# Altium project LTE-GNSS Asset Tracker.PrjPcb (part 1 of 3)
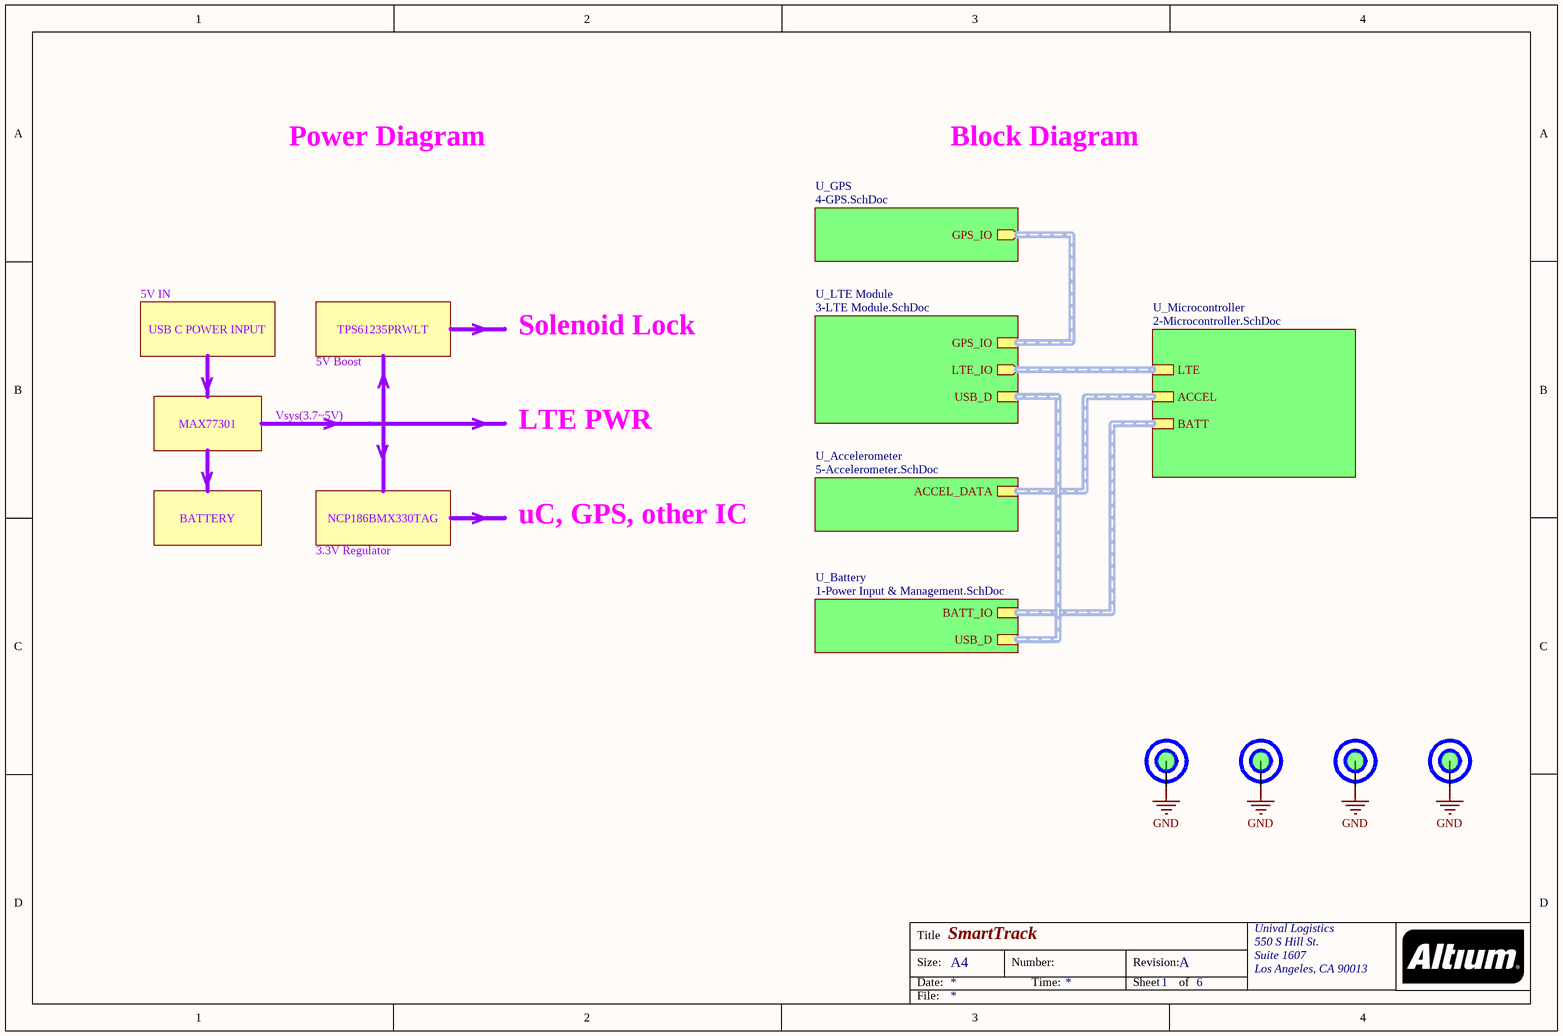
[diagram p0: Top.SchDoc]
6 sheets, 158 parts. Net scope: hierarchical (ports join the sheet entries above them; power ports are global).
Board file: LTE GNSS Tracker.PcbDoc
Sheets:
  Top.SchDoc
    U_Battery = 1-Power Input & Management.SchDoc
    U_LTE Module = 3-LTE Module.SchDoc
    U_GPS = 4-GPS.SchDoc
    U_Accelerometer = 5-Accelerometer.SchDoc
    U_Microcontroller = 2-Microcontroller.SchDoc

## Sheet Top.SchDoc: SmartTrack
size A4; Engineer: ZMP; Organization: Unival Logistics; Address1: 550 S Hill St.; Address2: Suite 1607; Address3: Los Angeles, CA 90013; Revision: A; SheetNumber: 1; SheetTotal: 6

### Parts
MNT1  MOUNTING HOLE  [MNT620-275N]  (value not drawn)
MNT2  MOUNTING HOLE  [MNT620-275N]  (value not drawn)
MNT3  MOUNTING HOLE  [MNT620-275N]  (value not drawn)
MNT4  MOUNTING HOLE  [MNT620-275N]  (value not drawn)

### Sub-sheets
U_Accelerometer = 5-Accelerometer.SchDoc: ACCEL_DATA (harness ACCEL)
U_Battery = 1-Power Input & Management.SchDoc: BATT_IO (harness I2C), USB_D (harness USB)
U_GPS = 4-GPS.SchDoc: GPS_IO (out, harness GPS)
U_LTE Module = 3-LTE Module.SchDoc: LTE_IO (out, harness LTE), GPS_IO (harness GPS), USB_D (harness USB)
U_Microcontroller = 2-Microcontroller.SchDoc: ACCEL (harness ACCEL), LTE (harness LTE), BATT (harness I2C)

### Nets
GND: MNT1.1(GND) MNT2.1(GND) MNT3.1(GND) MNT4.1(GND)

### Buses and harness runs
harness sheet U_Accelerometer/ACCEL_DATA = sheet U_Microcontroller/ACCEL
harness sheet U_Battery/BATT_IO = sheet U_Microcontroller/BATT
harness sheet U_Battery/USB_D = sheet U_LTE Module/USB_D
harness sheet U_GPS/GPS_IO = sheet U_LTE Module/GPS_IO
harness sheet U_LTE Module/LTE_IO = sheet U_Microcontroller/LTE

### Notes on the sheet
- Power Diagram
- Block Diagram
- 5V IN
- USB C POWER INPUT
- 5V Boost
- TPS61235PRWLT
- V
- Solenoid Lock
- MAX77301
- Vsys(3.7~5V)
- LTE PWR
- BATTERY
- NCP186BMX330TAG
- 3.3V Regulator
- uC, GPS, other IC
- Title
- Size:
- Date:
- A4
- Number:
- Time:
- Revision:
- Sheet
- of
- File:

### Library data of the parts
MNT1-MNT4 = MNT_1: Part #: NA; Notes: PCB; Emcraft #: NA

## Sheet 1-Power Input & Management.SchDoc: Power Input & Management
size A4; Organization: Unival Logistics; Address1: 550 S Hill St.; Address2: Suite 1607; Address3: Los Angeles, CA 90013; Revision: A; SheetNumber: 2; SheetTotal: 6
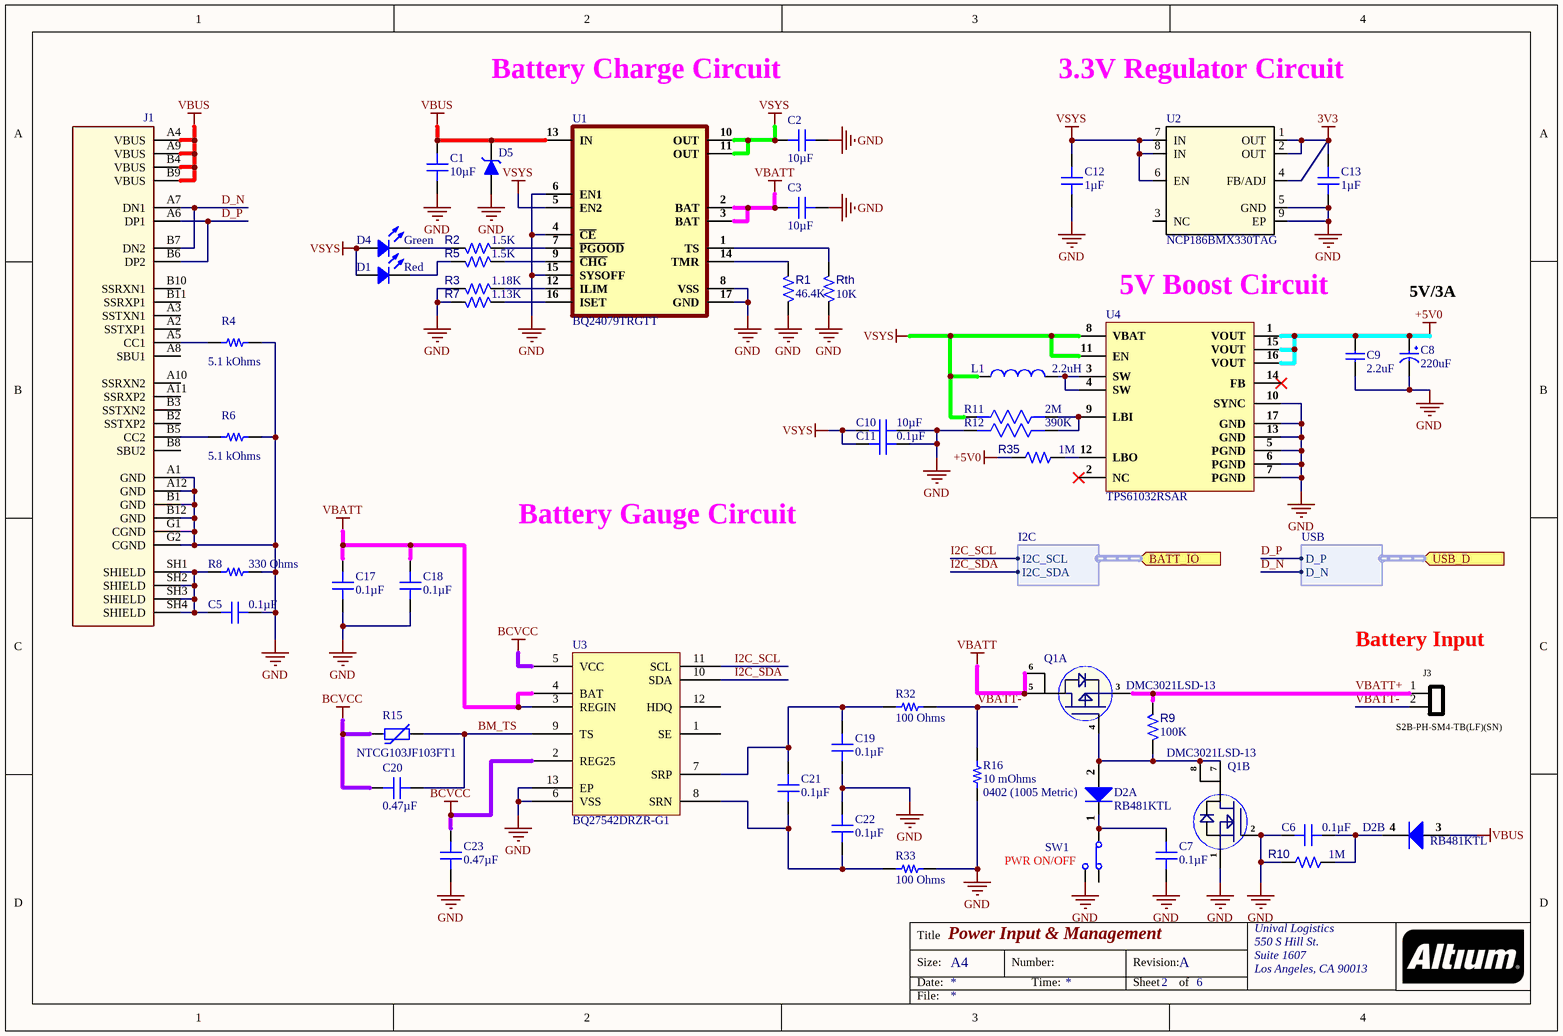
[diagram p1: 1-Power Input & Management.SchDoc]

### Parts
C1  10µF  [CAPC1608X06L]
C2  10µF  [CAPC1608X06L]
C3  10µF  [CAPC1608X06L]
C5  0.1µF  [CAP 0201_0603]
C6  0.1µF  [CAP 0201_0603]
C7  0.1µF  [CAP 0201_0603]
C8  220uF  [T491D227K016AT]
C9  2.2uF  [CAP 0201]
C10  10µF  [Cap 0603]
C11  0.1µF  [CAP 0201]
C12  1µF  [CAP 0402_1005]
C13  1µF  [CAP 0402_1005]
C17  0.1µF  [CAP 0201_0603]
C18  0.1µF  [CAP 0201_0603]
C19  0.1µF  [CAP 0201_0603]
C20  0.47µF  [CAP 0201_0603]
C21  0.1µF  [CAP 0201_0603]
C22  0.1µF  [CAP 0201_0603]
C23  0.47µF  [CAP 0201_0603]
D1  Red  [LED 0402_1005 RED]
D2  RB481KTL  [RB481KTL]  (parts A,B of 2)
D4  Green  [LED 0402_1005 GREEN]
D5  BZT52C6V2S-F2-0000HF  [BZT52C6V2S-F2-0000HF]  (value not drawn)
J1  632723100011  [632723100011]  (value not drawn)
J3  S2B-PH-SM4-TB(LF)(SN)  [JST_S2B-PH-SM4-TB(LF)(SN)]
L1  2.2uH  [NRS8030T2R2NJGJ]
Q1  DMC3021LSD-13  [DMC2020USD-13]  (parts A,B of 2)
R1  46.4K  [RES 0201_0603]
R2  1.5K  [RES 0201_0603]
R3  1.18K  [RES 0201_0603]
R4  5.1 kOhms  [RES 0201_0603]
R5  1.5K  [RES 0201_0603]
R6  5.1 kOhms  [RES 0201_0603]
R7  1.13K  [RES 0201_0603]
R8  330 Ohms  [RES 0201_0603]
R9  100K  [RES 0201_0603]
R10  1M  [RES 0201_0603]
R11  2M  [Res-0201]
R12  390K  [Res-0201]
R15  NTCG103JF103FT1  [NTC 0402_1005]
R16  10 mOhms  Package / Case: 0402 (1005 Metric)  [STACKPOLE CSR0402]
R32  100 Ohms  [RES 0201_0603]
R33  100 Ohms  [RES 0201_0603]
R35  1M  [Res-0201]
Rth  10K  [STACKPOLE CSR0402]
SW1  PWR ON/OFF  [SW_JS102011JCQN]
U1  BQ24079TRGTT  [BQ24079TRGTT]
U2  NCP186BMX330TAG  [8-XDFN]
U3  BQ27542DRZR-G1  [TI SON-12 DRZ]
U4  TPS61032RSAR  [TPS61032RSAR]

### Ports
BATT_IO (in, harness I2C), USB_D (in, harness USB)

### Harnesses
I2C: I2C_SCL, I2C_SDA
USB: D_P, D_N

### Nets
3V3: C13.2 U2.1(OUT) U2.2(OUT) U2.4(FB/ADJ)
+5V0: C8.1 C9.2 R35.1 U4.1(VOUT) U4.15(VOUT) U4.16(VOUT)
BCVCC: C20.1 C23.2 R15.1 U3.2(REG25) U3.5(VCC)
GND: C1.1 C2.1 C3.1 C5.1 C6.1 C7.1 C8.2 C9.1 C10.1 C11.1 C12.1 C13.1 C17.1 C18.1 C19.1 C22.2 C23.1 D5.2(A) J1.A1(GND) J1.A12(GND) J1.B1(GND) J1.B12(GND) J1.G1(CGND) J1.G2(CGND) Q1.1(S2) Q1.2(G2) R1.2 R3.1 R4.2 R6.2 R7.2 R8.2 R10.1 R12.2 R16.1 R33.2 Rth.2 SW1.3 U1.4(~{CE}) U1.6(EN1) U1.8(VSS) U1.15(SYSOFF) U1.17(GND) U2.5(GND) U2.9(EP) U3.6(VSS) U3.13(EP) U4.5(PGND) U4.6(PGND) U4.7(PGND) U4.10(SYNC) U4.13(GND) U4.17(GND)
VBATT: C3.2 C17.2 C18.2 Q1.5(D1) Q1.6(D1) U1.2(BAT) U1.3(BAT) U3.3(REGIN) U3.4(BAT)
VBUS: C1.2 D2.3(A) D5.1(K) J1.A4(VBUS) J1.A9(VBUS) J1.B4(VBUS) J1.B9(VBUS) U1.13(IN)
VSYS: C2.2 C10.2 C11.2 C12.2 D1.1 D4.1 L1.1 R11.2 U1.5(EN2) U1.10(OUT) U1.11(OUT) U2.6(EN) U2.7(IN) U2.8(IN) U4.8(VBAT) U4.11(EN)
BM_TS: C20.2 R15.2 U3.9(TS)
D_N: J1.A7(DN1) J1.B7(DN2) ; port USB_D.D_N
D_P: J1.A6(DP1) J1.B6(DP2) ; port USB_D.D_P
I2C_SCL: U3.11(SCL) ; port BATT_IO.I2C_SCL
I2C_SDA: U3.10(SDA) ; port BATT_IO.I2C_SDA
VBATT+: J3.1(Pin) Q1.3(S1) R9.2
VBATT-: J3.2(Pin) R16.2 R32.2
NetC5_2: C5.2 J1.SH1(SHIELD) J1.SH2(SHIELD) J1.SH3(SHIELD) J1.SH4(SHIELD) R8.1
NetC6_2: C6.2 D2.4(K) R10.2
NetC7_2: C7.2 D2.1(K) SW1.2
NetC19_2: C19.2 C21.2 R32.1 U3.7(SRP)
NetC21_1: C21.1 C22.1 R33.1 U3.8(SRN)
NetD1_2: D1.2 R5.2
NetD2_2: D2.2(A) Q1.4(G1) Q1.7(D2) Q1.8(D2) R9.1
NetD4_2: D4.2 R2.2
NetJ1_A5: J1.A5(CC1) R4.1
NetJ1_B5: J1.B5(CC2) R6.1
NetL1_2: L1.2 U4.3(SW) U4.4(SW)
NetR1_1: R1.1 U1.14(TMR)
NetR2_1: R2.1 U1.7(~{PGOOD})
NetR3_2: R3.2 U1.12(ILIM)
NetR5_1: R5.1 U1.9(~{CHG})
NetR7_1: R7.1 U1.16(ISET)
NetR11_1: R11.1 R12.1 U4.9(LBI)
NetR35_2: R35.2 U4.12(LBO)
NetRth_1: Rth.1 U1.1(TS)

Not connected (* = marked no-connect by the designer): J1 A2(SSTXP1) A3(SSTXN1) A8(SBU1) A10(SSRXN2) A11(SSRXP2) B2(SSTXP2) B3(SSTXN2) B8(SBU2) B10(SSRXN1) B11(SSRXP1); SW1 1; U2 3(NC); U3 1(SE) 12(HDQ); U4 2(NC)* 14(FB)*

### Notes on the sheet
- Battery Charge Circuit
- 3.3V Regulator Circuit
- 5V Boost Circuit
- 5V/3A
- Battery Gauge Circuit
- (near J3) Battery Input
- Title
- Size:
- Date:
- A4
- Number:
- Time:
- Revision:
- Sheet
- of
- File:

### Library data of the parts
C1-C3 C10 = Capacitor: CAP CER 10UF 16V X5R 0603; Part Number: C1608X5R1C106M080AB; Manufacturer: TDK Corporation; Tolerance: ±10%; Value: 10µF; Applications: General Purpose; Capacitance: 10µF; ComponentLink1Description: Datasheet; ComponentLink1URL: http://www.samsungsem.com/kr/support/product-search/mlcc/CL32B106KBJNNNE .jsp; ComponentLink2Description: DigiKey Link; ComponentLink2URL: http://digikey.com/product-detail/en/samsung-electro-mechanics/CL32B106KBJNNNE/1276-3387-1-ND/3891473; Device Package: 0603 (1608 Metric); LastUpdated: 21/01/2020 00:30:21; Lifecycle Status: Active; Minimum Order: 1; Mounting Type: Surface Mount, MLCC; Operating Temperature: -55°C ~ 125°C; Package / Case: 0603 (1608 Metric); Packaging: TapeAndReel; PartId: 24115; Part Status: Active; Price: 0.17; Series: CL; Size / Dimension: 0.063" L x 0.031" W (1.60mm x 0.80mm); Supplier 1: DigiKey; Supplier Part Number 1: 445-9065-2-ND; Temperature Coefficient: X5R; Thickness (Max): 0.106" (2.70mm); Voltage - Rated: 16V
C5-C7 = GRM033R61C104ME84D: CAP CER 0.1UF 16V X5R 0201; Manufacturer: Murata Electronics; Tolerance: ±20%; Part Number: GRM033R61C104ME84D; Value: 0.1µF; Applications: General Purpose; Capacitance: 0.1µF; ComponentLink1Description: Datasheet; ComponentLink1URL: https://search.murata.co.jp/Ceramy/image/img/A01X/G101/ENG/GRM033R61C104ME84-01.pdf; ComponentLink2Description: DigiKey Link; ComponentLink2URL: http://digikey.com/product-detail/en/murata-electronics/GRM033R61C104ME84D/490-9986-1-ND/5026291; Device Package: 0201 (0603 Metric); LastUpdated: 21/01/2020 00:00:12; Lifecycle Status: Active; Minimum Order: 1; Mounting Type: Surface Mount, MLCC; Operating Temperature: -55°C ~ 85°C; Package / Case: 0201 (0603 Metric); Packaging: TapeAndReel; PartId: 1522; Part Status: Active; Price: 0.01; Series: GRM; Size / Dimension: 0.024" L x 0.012" W (0.60mm x 0.30mm); Supplier 1: DigiKey; Supplier Part Number 1: 490-9986-1-ND; Temperature Coefficient: X5R; Thickness (Max): 0.013" (0.33mm); Voltage - Rated: 16V
C8 = T491D227K016AT: CAP TANT 220UF 10% 16V 2917; Manufacturer: KEMET; Dielectric Material: Tantalum; ESR (Equivalent Series Resistance): 900mR; Leakage Current: 35.2uA; Supplier 1: RSComponents; Manufacturer Part Number: T491D227K016AT; RoHS: Yes; Category: Tantalum Capacitors; Stock 1: 35; Pricing 1: 5=2.59000, 50=2.41000, 100=2.25400, 250=2.09800, 500=1.89100 (USD); Mount: Surface Mount; Case/Package: 2917; Number of Pins: 2; Case Code (Metric): 7343; Case Code (Imperial): 2917; Min Operating Temperature: -55°C; Max Operating Temperature: 125°C; Packaging: Cut Tape; Capacitance: 220uF; Voltage Rating: 16V; Tolerance: 10%; Features: General Purpose; Package Quantity: 1; Voltage: 16V; Termination: SMD/SMT; Voltage Rating (DC): 16V; Series: T491; Construction: Flat; Length: 7.3mm; Width: 0.169inch; Height: 2.8mm; Height - Seated (Max): 0.122inch; Depth: 4.3mm; Radiation Hardening: No; REACH SVHC: No SVHC; Lead Free: Lead Free; RoHS Compliant: Yes; ComponentLink1URL: https://datasheet.ciiva.com/14885/kem-t2005-t491-14885000.pdf?src-supplier=Digi-Key; ComponentLink1Description: https://datasheet.ciiva.com/14885/kem-t2005-t491-14885000.pdf?src-supplier=Digi-Key; ComponentLink2URL: https://datasheet.ciiva.com/14884/kem-t2005-t491-14884999.pdf?src-supplier=Digi-Key; ComponentLink2Description: https://datasheet.ciiva.com/14884/kem-t2005-t491-14884999.pdf?src-supplier=Digi-Key; ComponentLink3URL: https://datasheet.ciiva.com/14885/kem-t2005-t491-14885001.pdf?src-supplier=Digi-Key; ComponentLink3Description: https://datasheet.ciiva.com/14885/kem-t2005-t491-14885001.pdf?src-supplier=Digi-Key; Supplier Part Number 1: 8015479
C9 = GRM033R61A225ME47D: CAP CER 2.2UF 10V X5R 0201; Manufacturer: Murata; Tolerance: 20%; Supplier 1: Avnet; Manufacturer Part Number: GRM033R61A225ME47D; RoHS: Yes; Category: Ceramic Capacitors; Pricing 1: 15000=0.04772, 30000=0.04483, 60000=0.04193, 90000=0.03904, 120000=0.03615, 150000=0.03495, 1500000=0.03374 (USD); Mount: Surface Mount; Case/Package: 0201; Case Code (Metric): 0603; Case Code (Imperial): 0201; Min Operating Temperature: -55°C; Max Operating Temperature: 85°C; Packaging: Tape and Reel; Capacitance: 2.2uF; Voltage Rating: 10V; Voltage Rating (DC): 10V; Dielectric: X5R; Length: 0.024inch; Width: 0.012inch; Thickness: 0.015inch; RoHS Compliant: Yes; ComponentLink1URL: http://search.murata.co.jp/Ceramy/image/img/A01X/G101/ENG/GRM033R61A225ME47-01.pdf?src-supplier=Digi-Key; ComponentLink1Description: http://search.murata.co.jp/Ceramy/image/img/A01X/G101/ENG/GRM033R61A225ME47-01.pdf?src-supplier=Digi-Key; ComponentLink2URL: https://www.murata.com/~/media/webrenewal/support/library/catalog/products/capacitor/mlcc/c02e.ashx?la=en-us&src-supplier=Digi-Key; ComponentLink2Description: https://www.murata.com/~/media/webrenewal/support/library/catalog/products/capacitor/mlcc/c02e.ashx?la=en-us&src-supplier=Digi-Key; Supplier Part Number 1: GRM033R61A225ME47D
C11 C17-C19 C21 C22 = Capacitor: CAP CER 0.1UF 16V X5R 0201; Part Number: GRM033R61C104ME84D; Manufacturer: Murata Electronics; Tolerance: ±20%; Value: 0.1µF; Applications: General Purpose; Capacitance: 0.1µF; ComponentLink1Description: Datasheet; ComponentLink1URL: https://search.murata.co.jp/Ceramy/image/img/A01X/G101/ENG/GRM033R61C104ME84-01.pdf; ComponentLink2Description: DigiKey Link; ComponentLink2URL: http://digikey.com/product-detail/en/murata-electronics/GRM033R61C104ME84D/490-9986-1-ND/5026291; Device Package: 0201 (0603 Metric); LastUpdated: 21/01/2020 00:00:12; Lifecycle Status: Active; Minimum Order: 1; Mounting Type: Surface Mount, MLCC; Operating Temperature: -55°C ~ 85°C; Package / Case: 0201 (0603 Metric); Packaging: TapeAndReel; PartId: 1522; Part Status: Active; Price: 0.01; Series: GRM; Size / Dimension: 0.024" L x 0.012" W (0.60mm x 0.30mm); Supplier 1: DigiKey; Supplier Part Number 1: 490-9986-1-ND; Temperature Coefficient: X5R; Thickness (Max): 0.013" (0.33mm); Voltage - Rated: 16V
C12 C13 = Capacitor: CAP CER 1UF 16V X5R 0402; Part Number: GRM155R61C105MA12D; Manufacturer: Murata Electronics; Tolerance: ±20%; Value: 1µF; Applications: General Purpose; Capacitance: 1µF; ComponentLink1Description: Datasheet; ComponentLink1URL: https://search.murata.co.jp/Ceramy/image/img/A01X/G101/ENG/GRM155R61C105MA12-01.pdf; ComponentLink2Description: DigiKey Link; ComponentLink2URL: http://digikey.com/product-detail/en/murata-electronics/GRM155R61C105MA12D/490-14599-1-ND/6606205; Device Package: 0402 (1005 Metric); LastUpdated: 01/04/2020 23:56:41; Lifecycle Status: Active; Minimum Order: 1; Mounting Type: Surface Mount, MLCC; Operating Temperature: -55°C ~ 85°C; Package / Case: 0402 (1005 Metric); Packaging: TapeAndReel; PartId: 10295; Part Status: Active; Price: 0.01; Series: GRM; Size / Dimension: 0.039" L x 0.020" W (1.00mm x 0.50mm); Supplier 1: DigiKey; Supplier Part Number 1: 490-14599-1-ND; Temperature Coefficient: X5R; Thickness (Max): 0.022" (0.55mm); Voltage - Rated: 16V
C20 C23 = Capacitor: CAP CER 0.47UF 10V X5R 0201; Part Number: C0603X5R1A474M030BC; Manufacturer: TDK Corporation; Tolerance: ±20%; Value: 0.47µF; Applications: General Purpose; Capacitance: 0.47µF; ComponentLink1Description: Datasheet; ComponentLink1URL: https://search.murata.co.jp/Ceramy/image/img/A01X/G101/ENG/GRM033R60J474ME90-01.pdf; ComponentLink2Description: DigiKey Link; ComponentLink2URL: http://digikey.com/product-detail/en/murata-electronics/GRM033R60J474ME90D/490-10410-1-ND/5026287; Device Package: 0201 (0603 Metric); LastUpdated: 21/01/2020 00:00:17; Lifecycle Status: Active; Minimum Order: 1; Mounting Type: Surface Mount, MLCC; Operating Temperature: -55°C ~ 85°C; Package / Case: 0201 (0603 Metric); Packaging: TapeAndReel; PartId: 705; Part Status: Active; Price: 0.02; Size / Dimension: 0.024" L x 0.012" W (0.60mm x 0.30mm); Supplier 1: DigiKey; Supplier Part Number 1: 445-13666-2-ND; Temperature Coefficient: X5R; Thickness (Max): 0.013" (0.33mm); Voltage - Rated: 10V
D1 = LED: LED RED CLEAR 0402 SMD; Part Number: IN-S42ATR; Manufacturer: Inolux; Configuration: Standard; Current - Test: 20mA; Lens Size: 0.60mm x 0.45mm; Lens Style: Rectangle with Flat Top; Millicandela Rating: 90mcd; Viewing Angle: 130°; Voltage - Forward (Vf) (Typ): 2.1V; Wavelength - Dominant: 631nm; Wavelength - Peak: 645nm; Color: Red; ComponentLink1Description: Datasheet; ComponentLink1URL: http://www.inolux-corp.com/datasheet/SMDLED/Mono%20Color%20Top%20View/IN-S42AT%20Series_V1.1.pdf; ComponentLink2Description: DigiKey Link; ComponentLink2URL: http://digikey.com/product-detail/en/inolux/IN-S42ATR/1830-1057-1-ND/7604692; Device Package: 0402 (1005 Metric); Height (Max): 0.55mm; LastUpdated: 21/01/2020 03:12:45; Lens Color: Clear; Lens Transparency: Clear; Lifecycle Status: Active; Minimum Order: 1; Mounting Type: Surface Mount; Package / Case: 0402 (1005 Metric); Packaging: TapeAndReel; PartId: 504; Part Status: Active; Price: 0.06; Series: IN-S42AT; Size / Dimension: 1.00mm L x 0.50mm W; Supplier 1: DigiKey; Supplier Part Number 1: 1830-1057-1-ND; Supplier Device Package: 0402; Value: Red
D2 = RB481KTL: Diode Small Signal Schottky 30V 0.2A Automotive 4-Pin UMD T/R; Manufacturer: Rohm; Forward Current: 200mA; Peak Non-Repetitive Surge Current: 1A; Forward Voltage: 500mV; Max Reverse Leakage Current: 30uA; Supplier 1: Digi-Key; Manufacturer Part Number: RB481KTL; RoHS: Yes; Category: Schottky Diodes; Stock 1: 154; Pricing 1: 1=0.51000, 10=0.43300, 100=0.32340 (USD); Mount: Surface Mount; Case/Package: SOT-343; Number of Pins: 4; Max Operating Temperature: 125°C; Max Repetitive Reverse Voltage (Vrrm): 30V; Package Quantity: 1; Packaging: Tape and Reel; Max Surge Current: 1A; Average Rectified Current: 200mA; Max Forward Surge Current (Ifsm): 1A; Termination: SMD/SMT; Max Reverse Current: 30uA; Current Rating: 200mA; Voltage Rating (DC): 30V; Max Reverse Voltage (DC): 30V; Series: -; Length: 2mm; Width: 1.25mm; Height: 0.9mm; Radiation Hardening: No; REACH SVHC: No SVHC; Lead Free: Lead Free; RoHS Compliant: Yes; ComponentLink1URL: https://datasheet.ciiva.com/906/rb481k-906368.pdf?src-supplier=Digi-Key; ComponentLink1Description: https://datasheet.ciiva.com/906/rb481k-906368.pdf?src-supplier=Digi-Key; ComponentLink2URL: https://datasheet.ciiva.com/5739/24652-5739061.pdf?src-supplier=Farnell; ComponentLink2Description: https://datasheet.ciiva.com/5739/24652-5739061.pdf?src-supplier=Farnell; ComponentLink3URL: https://datasheet.ciiva.com/25968/rb481k-25968757.pdf?src-supplier=Avnet+Europe; ComponentLink3Description: https://datasheet.ciiva.com/25968/rb481k-25968757.pdf?src-supplier=Avnet+Europe; ComponentLink4URL: https://datasheet.ciiva.com/13083/rb481k-210787-13083722.pdf?src-supplier=Mouser; ComponentLink4Description: https://datasheet.ciiva.com/13083/rb481k-210787-13083722.pdf?src-supplier=Mouser; ComponentLink5URL: https://datasheet.ciiva.com/26325/140681-da-01-en-schottky-diode-rb481ktl-sot-343-26325256.pdf?src-supplier=Conrad; ComponentLink5Description: https://datasheet.ciiva.com/26325/140681-da-01-en-schottky-diode-rb481ktl-sot-343-26325256.pdf?src-supplier=Conrad; ComponentLink6URL: https://datasheet.ciiva.com/16481/rb481k-16481067.pdf?src-supplier=Future+Electronics; ComponentLink6Description: https://datasheet.ciiva.com/16481/rb481k-16481067.pdf?src-supplier=Future+Electronics; Supplier Part Number 1: 846-RB481KTLCT-ND
D4 = LED: LED GREEN CLEAR 0402 SMD; Part Number: QBLP595-IG; Manufacturer: QT Brightek (QTB); Configuration: Standard; Current - Test: 20mA; Lens Color: Colorless; Lens Size: 0.70mm x 0.50mm; Lens Style: Rectangle with Flat Top; Millicandela Rating: 600mcd; Viewing Angle: 140°; Voltage - Forward (Vf) (Typ): 3.1V; Wavelength - Dominant: 520nm; Color: Green; ComponentLink1Description: Datasheet; ComponentLink1URL: http://www.qt-brightek.com/datasheet/QBLP595 Series.pdf; ComponentLink2Description: DigiKey Link; ComponentLink2URL: http://digikey.com/product-detail/en/qt-brightek-qtb/QBLP595-IG/1516-1216-1-ND/6201913; Device Package: 0402 (1005 Metric); Height (Max): 0.60mm; LastUpdated: 21/01/2020 03:11:39; Lens Transparency: Clear; Lifecycle Status: Active; Minimum Order: 1; Mounting Type: Surface Mount; Package / Case: 0402 (1005 Metric); Packaging: TapeAndReel; PartId: 717; Part Status: Active; Price: 0.08; Series: QBLP595; Size / Dimension: 1.00mm L x 0.50mm W; Supplier 1: DigiKey; Supplier Part Number 1: 1516-1216-1-ND; Supplier Device Package: 0402; Value: Green
D5 = BZT52C6V2S-F2-0000HF: Zener Diode 6.2V 0.2W SOD-323; Manufacturer: Yangjie Electronic Technology; Supplier 1: Digi-Key; Manufacturer Part Number: BZT52C6V2S-F2-0000HF; RoHS: No; Category: Zener Diodes; Stock 1: 2869; Pricing 1: 1=0.22000, 10=0.17700, 100=0.09400, 500=0.06188, 1000=0.04208 (USD); Supplier Part Number 1: 3191-BZT52C6V2S-F2-0000HFCT-ND
J1 = 632723100011: CONN RCP USB3.1 TYPEC 24P SMD RA; Manufacturer: Würth Elektronik; Part Number: 632723100011; Supplier Part Number 1: 732-9617-2-ND; Supplier 1: Digi-Key
J3 = CON2: CONN HEADER SMD R/A 2POS 2MM; Supplier 1: Digi-Key; Supplier Part Number 1: 455-1749-2-ND; Part Number: S2B-PH-SM4-TB(LF)(SN); Package: S2B-PH-SM4-TB(LF)(SN); Price Estim. @ 100pcs: 0.5419; Value: S2B-PH-SM4-TB(LF)(SN)
L1 = NRS8030T2R2NJGJ: Inductor Power Shielded Wirewound 2.2uH 30% 100KHz Ferrite 4.8A 0.0195Ohm DCR 3131 T/R; Manufacturer: Taiyo Yuden; Self Resonant Frequency: 60MHz; Max DC Current: 4.9A; DC Resistance (DCR): 19.5mR; Supplier 1: Future Electronics; Manufacturer Part Number: NRS8030T2R2NJGJ; RoHS: Yes; Category: Fixed Inductors; Stock 1: 16000; Pricing 1: 1000=0.24000, 2000=0.19800, 3000=0.19600, 5000=0.19300, 10000=0.19000 (USD); Mount: Surface Mount; Case/Package: Nonstandard; Number of Pins: 2; Core Material: Ferrite; Min Operating Temperature: -25°C; Max Operating Temperature: 125°C; Inductance: 2.2uH; Tolerance: 30%; Packaging: Cut Tape; Package Quantity: 1000; Current Rating: 4.8A; Shielding: Shielded; Termination: SMD/SMT; Resistor Type: Wirewound; Test Frequency: 100kHz; Saturation Current: 4.9A; Series: NRS; Inductance Tolerance: 30%; RMS Current (Irms): 4.8A; Length: 8mm; Width: 8mm; Height: 3mm; Height - Seated (Max): 0.118inch; Depth: 8.2mm; Lead Pitch: 5.6mm; Radiation Hardening: No; RoHS Compliant: Yes; Lead Free: Lead Free; Halogen Free: Halogen Free; REACH SVHC: Unknown; ComponentLink1URL: https://datasheet.ciiva.com/8504/nrs8030t2r2njgj-ss-8504418.pdf?src-supplier=Avnet; ComponentLink1Description: https://datasheet.ciiva.com/8504/nrs8030t2r2njgj-ss-8504418.pdf?src-supplier=Avnet; ComponentLink2URL: https://datasheet.ciiva.com/6699/nrs8030t2r2njgj-ss-6699093.pdf?src-supplier=Digi-Key; ComponentLink2Description: https://datasheet.ciiva.com/6699/nrs8030t2r2njgj-ss-6699093.pdf?src-supplier=Digi-Key; ComponentLink3URL: https://datasheet.ciiva.com/25607/0900766b810b3cd2-25607146.pdf?src-supplier=RSComponents; ComponentLink3Description: https://datasheet.ciiva.com/25607/0900766b810b3cd2-25607146.pdf?src-supplier=RSComponents; Supplier Part Number 1: 1077538
Q1 = DMC3021LSD-13: MOSFET N/P-CH 30V 8.5A/7A 8SO; Manufacturer: Diodes; Gate to Source Voltage (Vgs): 20V; Rds On Max: 21mR; Input Capacitance: 767pF; Number of Elements: 2; Max Power Dissipation: 2.5W; Continuous Drain Current (ID): 8.5A; Drain to Source Resistance: 14mR; Turn-Off Delay Time: 50.1ns; FET Type: N and P-Channel; Polarity: N-CHANNEL,P-CHANNEL; Supplier 1: RSComponents; Manufacturer Part Number: DMC3021LSD-13; RoHS: Yes; Category: MOSFETs; Stock 1: 225; Pricing 1: 25=0.61700, 125=0.47900, 625=0.39900, 1250=0.32000 (USD); Mount: Surface Mount; Case/Package: SOIC; Number of Pins: 8; Weight: 0.00261oz; Min Operating Temperature: -55°C; Max Operating Temperature: 150°C; Packaging: Tape and Reel; Package Quantity: 2500; Power Dissipation: 2.5W; Drain to Source Voltage (Vdss): 30V; Number of Channels: 2; Series: -; Length: 4.95mm; Width: 3.95mm; Height: 1.5mm; Radiation Hardening: No; REACH SVHC: No SVHC; RoHS Compliant: Yes; ComponentLink1URL: https://datasheet.ciiva.com/4443/ds32152-88645-4443219.pdf?src-supplier=Mouser; ComponentLink1Description: https://datasheet.ciiva.com/4443/ds32152-88645-4443219.pdf?src-supplier=Mouser; ComponentLink2URL: https://datasheet.ciiva.com/928/ds32152-928775.pdf?src-supplier=Digi-Key; ComponentLink2Description: https://datasheet.ciiva.com/928/ds32152-928775.pdf?src-supplier=Digi-Key; ComponentLink3URL: https://datasheet.ciiva.com/928/ds32152-928776.pdf?src-supplier=Digi-Key; ComponentLink3Description: https://datasheet.ciiva.com/928/ds32152-928776.pdf?src-supplier=Digi-Key; ComponentLink4URL: https://datasheet.ciiva.com/928/ds32152-928777.pdf?src-supplier=Digi-Key; ComponentLink4Description: https://datasheet.ciiva.com/928/ds32152-928777.pdf?src-supplier=Digi-Key; Supplier Part Number 1: 7514067
R1 = RSMT0626: RES SMD 46.4K OHM 1% 1/20W 0201; Part Number: ERJ-1GNF4642C; Manufacturer: Panasonic Electronic Components; Value: 46.4K; Supplier Part Number 1: P123027TR-ND; ComponentLink1URL: https://chn-vm-apps.microchip.com/mchprepo/parts/Datasheets/AOA0000CE2.pdf; ComponentLink1Description: Datasheet; Supplier 1: Digi-Key
R2 R5 = RSMT0626: RES SMD 1.5K OHM 1% 1/20W 0201; Part Number: RC0201FR-071K5L; Manufacturer: Yageo; Value: 1.5K; Supplier Part Number 1: YAG2274TR-ND; ComponentLink1URL: https://chn-vm-apps.microchip.com/mchprepo/parts/Datasheets/AOA0000CE2.pdf; ComponentLink1Description: Datasheet; Supplier 1: Digi-Key
R3 = RSMT0626: RES SMD 1.18K OHM 1% 1/20W 0201; Part Number: RC0201FR-071K18L; Manufacturer: Yageo; Value: 1.18K; Supplier Part Number 1: YAG2473TR-ND; ComponentLink1URL: https://chn-vm-apps.microchip.com/mchprepo/parts/Datasheets/AOA0000CE2.pdf; ComponentLink1Description: Datasheet; Supplier 1: Digi-Key
R4 R6 = Resistor: RES SMD 5.1K OHM 1% 1/20W 0201; Part Number: AC0201FR-075K1L; Manufacturer: Yageo; Power (Watts): 0.05W, 1/20W; Temperature Coefficient: ±200ppm/°C; Value: 5.1 kOhms; ComponentLink1Description: Datasheet; ComponentLink1URL: https://industrial.panasonic.com/cdbs/www-data/pdf/RDA0000/AOA0000C304.pdf; ComponentLink2Description: DigiKey Link; ComponentLink2URL: http://digikey.com/product-detail/en/panasonic-electronic-components/ERJ-1GNF1002C/P122414CT-ND/7389440; Composition: Thick Film; Device Package: 0201 (0603 Metric); Features: Automotive AEC-Q200; Height - Seated (Max): 0.010" (0.26mm); LastUpdated: 21/01/2020 00:04:13; Lifecycle Status: Active; Minimum Order: 1; Number of Terminations: 2; Operating Temperature: -55°C ~ 125°C; Package / Case: 0201 (0603 Metric); Packaging: TapeAndReel; PartId: 2296; Part Status: Active; Price: 0.01; Ratings: AEC-Q200; Resistance: 5.1 kOhms; Series: ERJ; Size / Dimension: 0.024" L x 0.012" W (0.60mm x 0.30mm); Supplier 1: Digi-Key; Supplier Part Number 1: YAG5228TR-ND; Supplier Device Package: 0201; Tolerance: ±1%
R7 = RSMT0626: RES SMD 1.13K OHM 1% 1/20W 0201; Part Number: RC0201FR-071K13L; Manufacturer: Yageo; Value: 1.13K; Supplier Part Number 1: YAG2471TR-ND; ComponentLink1URL: https://chn-vm-apps.microchip.com/mchprepo/parts/Datasheets/AOA0000CE2.pdf; ComponentLink1Description: Datasheet; Supplier 1: Digi-Key
R8 = Resistor: RES SMD 330 OHM 1% 1/20W 0201; Part Number: RC0201FR-07330RL; Manufacturer: Yageo; Power (Watts): 0.05W, 1/20W; Temperature Coefficient: ±200ppm/°C; Value: 330 Ohms; ComponentLink1Description: Datasheet; ComponentLink1URL: https://industrial.panasonic.com/cdbs/www-data/pdf/RDA0000/AOA0000C304.pdf; ComponentLink2Description: DigiKey Link; ComponentLink2URL: http://digikey.com/product-detail/en/panasonic-electronic-components/ERJ-1GNF1002C/P122414CT-ND/7389440; Composition: Thick Film; Device Package: 0201 (0603 Metric); Features: Automotive AEC-Q200; Height - Seated (Max): 0.010" (0.26mm); LastUpdated: 21/01/2020 00:04:13; Lifecycle Status: Active; Minimum Order: 1; Number of Terminations: 2; Operating Temperature: -55°C ~ 125°C; Package / Case: 0201 (0603 Metric); Packaging: TapeAndReel; PartId: 2296; Part Status: Active; Price: 0.01; Ratings: AEC-Q200; Resistance: 330 Ohms; Series: ERJ; Size / Dimension: 0.024" L x 0.012" W (0.60mm x 0.30mm); Supplier 1: Digi-Key; Supplier Part Number 1: YAG2604TR-ND; Supplier Device Package: 0201; Tolerance: ±1%
R9 = RSMT0626: RES 100K OHM 1% 1/20W 0201; Part Number: RMCF0201FT100K; Manufacturer: Stackpole Electronics Inc; Value: 100K; Supplier Part Number 1: RMCF0201FT100KTR-ND; ComponentLink1URL: https://chn-vm-apps.microchip.com/mchprepo/parts/Datasheets/AOA0000CE2.pdf; ComponentLink1Description: Datasheet; Supplier 1: Digi-Key
R10 R35 = RSMT0626: RES 1M OHM 1% 1/20W 0201; Part Number: RMCF0201FT1M00; Manufacturer: Stackpole Electronics Inc; Value: 1M; Supplier Part Number 1: RMCF0201FT1M00TR-ND; ComponentLink1URL: https://chn-vm-apps.microchip.com/mchprepo/parts/Datasheets/AOA0000CE2.pdf; ComponentLink1Description: Datasheet; Supplier 1: Digi-Key
R11 = ERJ-1GNJ205C: Res Thick Film 0201 2M Ohm 5% 1/20W -400ppm/°C to 150ppm/°C Molded SMD SMD T/R; Manufacturer: Panasonic; Resistance: 2MR; Power Rating: 50mW; Voltage Rating: 25V; Supplier 1: Digi-Key; Manufacturer Part Number: ERJ-1GNJ205C; RoHS: Yes; Category: Chip SMD Resistors; Stock 1: 118626; Pricing 1: 1=0.10000, 10=0.03400, 100=0.01400, 1000=0.00629, 2500=0.00546, 5000=0.00451 (USD); Mount: Surface Mount; Case/Package: 0201; Case Code (Metric): 0603; Case Code (Imperial): 0201; Min Operating Temperature: -55°C; Max Operating Temperature: 125°C; Package Quantity: 15000; Tolerance: 5%; Packaging: Tape and Reel; Resistor Type: Thick Film; Number of Terminations: 2; Temperature Coefficient: 150ppm/°C; Max Power Dissipation: 50mW; Termination: SMD/SMT; Length: 0.024inch; Width: 0.012inch; Height: 0.01inch; RoHS Compliant: Yes; ComponentLink1URL: http://www.onlinecomponents.com/datasheet/erj-1gnj205c.aspx?p=44467765&src-supplier=Onlinecomponents.com; ComponentLink1Description: http://www.onlinecomponents.com/datasheet/erj-1gnj205c.aspx?p=44467765&src-supplier=Onlinecomponents.com; ComponentLink2URL: http://www.mouser.com/ds/2/315/AOA0000CE1-37422.pdf?src-supplier=Mouser; ComponentLink2Description: http://www.mouser.com/ds/2/315/AOA0000CE1-37422.pdf?src-supplier=Mouser; ComponentLink3URL: https://b2b-api.panasonic.eu/file_stream/pids/fileversion/1242?src-supplier=Digi-Key; ComponentLink3Description: https://b2b-api.panasonic.eu/file_stream/pids/fileversion/1242?src-supplier=Digi-Key; ComponentLink4URL: http://industrial.panasonic.com/www-cgi/jvcr13pz.cgi?E+PZ+3+AOA0002+ERJ1GNJ205C+7+WW?src-supplier=Digi-Key; ComponentLink4Description: http://industrial.panasonic.com/www-cgi/jvcr13pz.cgi?E+PZ+3+AOA0002+ERJ1GNJ205C+7+WW?src-supplier=Digi-Key; ComponentLink5URL: https://industrial.panasonic.com/cdbs/www-data/pdf/RDM0000/DMM0000COL11.pdf?src-supplier=Digi-Key; ComponentLink5Description: https://industrial.panasonic.com/cdbs/www-data/pdf/RDM0000/DMM0000COL11.pdf?src-supplier=Digi-Key; Supplier Part Number 1: P123274CT-ND
R12 = ERJ-1GNJ394C: Res Thick Film 0201 390K Ohm 5% 1/20W ±200ppm/°C Molded SMD SMD T/R; Manufacturer: Panasonic; Resistance: 390kR; Power Rating: 50mW; Voltage Rating: 25V; Supplier 1: Digi-Key; Manufacturer Part Number: ERJ-1GNJ394C; RoHS: Yes; Category: Chip SMD Resistors; Stock 1: 14453; Pricing 1: 1=0.10000, 10=0.03400, 100=0.01400, 1000=0.00629, 2500=0.00546, 5000=0.00451 (USD); Mount: Surface Mount; Case/Package: 0201; Case Code (Imperial): 0201; Case Code (Metric): 0603; Min Operating Temperature: -55°C; Max Operating Temperature: 125°C; Packaging: Tape and Reel; Tolerance: 5%; Package Quantity: 15000; Resistor Type: Thick Film; Max Power Dissipation: 50mW; Number of Terminations: 2; Temperature Coefficient: 200ppm/°C; Length: 0.024inch; Width: 0.3mm; Height: 0.01inch; ComponentLink1URL: http://www.onlinecomponents.com/datasheet/erj-1gnj394c.aspx?p=44467790&src-supplier=Onlinecomponents.com; ComponentLink1Description: http://www.onlinecomponents.com/datasheet/erj-1gnj394c.aspx?p=44467790&src-supplier=Onlinecomponents.com; ComponentLink2URL: http://www.mouser.com/ds/2/315/AOA0000CE1-37422.pdf?src-supplier=Mouser; ComponentLink2Description: http://www.mouser.com/ds/2/315/AOA0000CE1-37422.pdf?src-supplier=Mouser; ComponentLink3URL: http://industrial.panasonic.com/www-cgi/jvcr13pz.cgi?E+PZ+3+AOA0002+ERJ1GNJ394C+7+WW?src-supplier=Digi-Key; ComponentLink3Description: http://industrial.panasonic.com/www-cgi/jvcr13pz.cgi?E+PZ+3+AOA0002+ERJ1GNJ394C+7+WW?src-supplier=Digi-Key; ComponentLink4URL: https://b2b-api.panasonic.eu/file_stream/pids/fileversion/1242?src-supplier=Digi-Key; ComponentLink4Description: https://b2b-api.panasonic.eu/file_stream/pids/fileversion/1242?src-supplier=Digi-Key; Supplier Part Number 1: P123319CT-ND
R15 = Thermistor: THERMISTOR NTC 10KOHM 3380K 0402; Manufacturer: TDK Corporation; B25/85: 3435K; B Value Tolerance: ±1%; Power - Max: 100mW; Resistance in Ohms @ 25°C: 10k; Part Number: NTCG103JF103FT1; B25/50: 3380K; ComponentLink1Description: Datasheet; ComponentLink1URL: https://product.tdk.com/info/en/catalog/datasheets/503021/tpd_commercial_ntc-thermistor_ntcg_en.pdf?ref_disty=digikey; ComponentLink2Description: DigiKey Link; ComponentLink2URL: http://digikey.com/product-detail/en/tdk-corporation/NTCG103JF103FT1/445-2550-1-ND/934249; Device Package: 0402 (1005 Metric); LastUpdated: 21/01/2020 03:30:28; Lifecycle Status: Active; Minimum Order: 1; Mounting Type: Surface Mount; Operating Temperature: -40°C ~ 125°C; Package / Case: 0402 (1005 Metric); Packaging: TapeAndReel; PartId: 199; Part Status: Active; Price: 0.03; Resistance Tolerance: ±1%; Series: NTCG; Supplier 1: DigiKey; Supplier Part Number 1: 445-2550-1-ND
R16 = Resistor: RES 0.01 OHM 1% 1/5W 0402; Part Number: ERJ-2LWFR010X; Manufacturer: Panasonic Electronic Components; Power (Watts): 0.2W, 1/5W; Temperature Coefficient: 0/ +500ppm/°C; ComponentLink1Description: Datasheet; ComponentLink1URL: https://industrial.panasonic.com/cdbs/www-data/pdf/RDN0000/AOA0000C313.pdf; ComponentLink2Description: DigiKey Link; ComponentLink2URL: http://digikey.com/product-detail/en/panasonic-electronic-components/ERJ-2LWFR010X/P19181CT-ND/6004536; Composition: Thick Film; Device Package: 0402 (1005 Metric); Features: Current Sense; Height - Seated (Max): 0.018" (0.45mm); LastUpdated: 21/01/2020 02:16:15; Lifecycle Status: Active; Minimum Order: 1; Number of Terminations: 2; Operating Temperature: -55°C ~ 125°C; Packaging: TapeAndReel; PartId: 348; Part Status: Active; Price: 0.05; Resistance: 10 mOhms; Series: ERJ; Size / Dimension: 0.039" L x 0.020" W (1.00mm x 0.50mm); Supplier 1: DigiKey; Supplier Part Number 1: P19181CT-ND; Supplier Device Package: 0402; Tolerance: ±1%; Value: 10 mOhms
R32 R33 = Resistor: RES 100 OHM 1% 1/20W 0201; Part Number: RK73H1HTTC1000F; Manufacturer: KOA Speer Electronics, Inc.; Power (Watts): 0.05W, 1/20W; Temperature Coefficient: ±200ppm/°C; Value: 100 Ohms; ComponentLink1Description: Datasheet; ComponentLink1URL: http://www.koaspeer.com/catimages/Products/RK73H/RK73H.pdf; ComponentLink2Description: DigiKey Link; ComponentLink2URL: http://digikey.com/product-detail/en/koa-speer-electronics-inc/RK73H1HTTC1000F/2019-RK73H1HTTC1000FCT-ND/9845801; Composition: Thick Film; Device Package: 0201 (0603 Metric); Features: Automotive AEC-Q200, Moisture Resistant; Height - Seated (Max): 0.010" (0.26mm); LastUpdated: 21/01/2020 00:04:16; Lifecycle Status: Active; Minimum Order: 1; Number of Terminations: 2; Operating Temperature: -55°C ~ 155°C; Package / Case: 0201 (0603 Metric); Packaging: TapeAndReel; PartId: 1552; Part Status: Active; Price: 0.01; Ratings: AEC-Q200; Resistance: 100 Ohms; Series: RK73H; Size / Dimension: 0.024" L x 0.012" W (0.60mm x 0.30mm); Supplier 1: DigiKey; Supplier Part Number 1: 2019-RK73H1HTTC1000FCT-ND; Supplier Device Package: 0201; Tolerance: ±1%
Rth = RSMT0626: THERMISTOR NTC 10KOHM 3380K 0402; Part Number: NTCG103JF103HT1; Manufacturer: TDK Corporation; Value: 10K; Supplier Part Number 1: 445-174898-2-ND; ComponentLink1URL: https://chn-vm-apps.microchip.com/mchprepo/parts/Datasheets/AOA0000CE2.pdf; ComponentLink1Description: Datasheet; Supplier 1: Digi-Key
SW1 = SW_slide: SWITCH SLIDE SPDT 300MA 6V; Part Number: JS102011JCQN; Manufacturer: C&K; Supplier Part Number 1: CKN10721TR-ND; Supplier 1: Digi-Key
U1 = BQ24079TRGTT: Battery Charger Li-Ion 1500mA 4.1V 16-Pin VQFN EP T/R; Manufacturer: Texas Instruments; Min Supply Voltage: 4.35V; Max Supply Voltage: 6.4V; Output Current: 1.5A; Max Power Dissipation: 2.3W; Min Input Voltage: 4.3V; Operating Supply Current: 1.5mA; Number of Cells: 1; Supplier 1: Digi-Key; Manufacturer Part Number: BQ24079TRGTT; RoHS: Yes; Category: Battery Management; Stock 1: 10; Pricing 1: 1=3.03000, 10=2.72500, 25=2.57040, 100=2.19010 (USD); Case/Package: VQFN EP; Number of Pins: 16; Contact Plating: Gold; Min Operating Temperature: -40°C; Max Operating Temperature: 85°C; Output Voltage: 4.1V; Packaging: Tape and Reel; Package Quantity: 250; Series: -; Radiation Hardening: No; Lead Free: Lead Free; RoHS Compliant: Yes; ComponentLink1URL: https://datasheet.ciiva.com/15115/getdatasheetpartid-517600-15115033.pdf?src-supplier=Verical; ComponentLink1Description: https://datasheet.ciiva.com/15115/getdatasheetpartid-517600-15115033.pdf?src-supplier=Verical; ComponentLink2URL: https://datasheet.ciiva.com/1934/bq24075t-1934673.pdf?src-supplier=Digi-Key; ComponentLink2Description: https://datasheet.ciiva.com/1934/bq24075t-1934673.pdf?src-supplier=Digi-Key; Supplier Part Number 1: 296-BQ24079TRGTTCT-ND
U2 = NCP186BMX330TAG: IC REG LINEAR 3.3V 1A 8XDFN; Vendor: ON Semiconductor; Part Number: NCP186BMX330TAG; Supplier Part Number 1: NCP186BMX330TAGOSTR-ND; Manufacturer: ON Semiconductor; Supplier 1: Digi-Key; RefDes: RefDes; Type: DEV
U3 = TI BQ27542DRZR-G1: IC BATT FUEL GAUGE LI-ION 12SON; Manufacturer: Texas Instruments; Battery Chemistry: Lithium-Ion; Function: Battery Monitor; Interface: HDQ, I²C; Number of Cells: 1; Part Number: BQ27542DRZR-G1; ComponentLink1Description: Datasheet; ComponentLink1URL: http://www.ti.com/general/docs/suppproductinfo.tsp?distId=10&gotoUrl=http%3A%2F%2Fwww.ti.com%2Flit%2Fgpn%2Fbq27542-g1; ComponentLink2Description: DigiKey Link; ComponentLink2URL: http://digikey.com/product-detail/en/texas-instruments/BQ27542DRZR-G1/296-44346-1-ND/6110619; Device Package: 12-VFDFN Exposed Pad; LastUpdated: 30/03/2020 16:23:27; Lifecycle Status: Active; Minimum Order: 1; Mounting Type: Surface Mount; Operating Temperature: -40°C ~ 85°C (TA); Package / Case: 12-VFDFN Exposed Pad; Packaging: TapeAndReel; Part Status: Active; Price: 1.28; Series: Impedance Track™; Supplier 1: DigiKey; Supplier Part Number 1: 296-44346-1-ND; Supplier Device Package: 12-SON (2.5x4)
U4 = TPS61032RSAR: 5-V Output, 1-A, 96% Efficient Boost Converter w/20uA Iq in TSSOP-16 16-QFN -40 to 85; Manufacturer: Texas Instruments; Number of Outputs: 1; Output Voltage: 5V; Output Current: 1A; Min Input Voltage: 1.8V; Max Input Voltage: 5.5V; Switching Frequency: 600kHz; Synchronous Rectifier: Yes; Quiescent Current: 20uA; Output Type: Fixed; Output Configuration: Positive; Supplier 1: Digi-Key; Manufacturer Part Number: TPS61032RSAR; RoHS: Yes; Category: Voltage Regulators - Switching; Stock 1: 5439; Pricing 1: 1=3.13000, 10=2.80800, 25=2.65440, 100=2.30060, 250=2.18260, 500=1.95844, 1000=1.94775 (USD); Mount: Surface Mount; Case/Package: VQFN; Number of Pins: 16; Weight: 0.001464oz; Min Operating Temperature: -40°C; Max Operating Temperature: 85°C; Efficiency: 96%; Packaging: Tape and Reel; Package Quantity: 1; Max Output Current: 1A; Topology: Boost; Operating Supply Voltage: 5.5V; Series: -; Min Output Voltage: 5V; Nominal Output Voltage: 5V; Width: 4mm; Radiation Hardening: No; Lead Free: Lead Free; RoHS Compliant: Yes; REACH SVHC: No SVHC; ComponentLink1URL: https://datasheet.ciiva.com/15113/getdatasheetpartid-188315-15113727.pdf?src-supplier=Verical; ComponentLink1Description: https://datasheet.ciiva.com/15113/getdatasheetpartid-188315-15113727.pdf?src-supplier=Verical; ComponentLink2URL: https://datasheet.ciiva.com/26896/tps61032rsar-26896598.pdf?src-supplier=IIIC; ComponentLink2Description: https://datasheet.ciiva.com/26896/tps61032rsar-26896598.pdf?src-supplier=IIIC; ComponentLink3URL: https://datasheet.ciiva.com/22684/1902788-22684647.pdf?src-supplier=Element14; ComponentLink3Description: https://datasheet.ciiva.com/22684/1902788-22684647.pdf?src-supplier=Element14; ComponentLink4URL: https://datasheet.ciiva.com/2026/tps61030-2026190.pdf?src-supplier=Digi-Key; ComponentLink4Description: https://datasheet.ciiva.com/2026/tps61030-2026190.pdf?src-supplier=Digi-Key; ComponentLink5URL: https://datasheet.ciiva.com/2026/tps61030-2026189.pdf?src-supplier=Digi-Key; ComponentLink5Description: https://datasheet.ciiva.com/2026/tps61030-2026189.pdf?src-supplier=Digi-Key; ComponentLink6URL: https://datasheet.ciiva.com/2026/tps61030-2026191.pdf?src-supplier=Digi-Key; ComponentLink6Description: https://datasheet.ciiva.com/2026/tps61030-2026191.pdf?src-supplier=Digi-Key; Supplier Part Number 1: 296-16662-6-ND